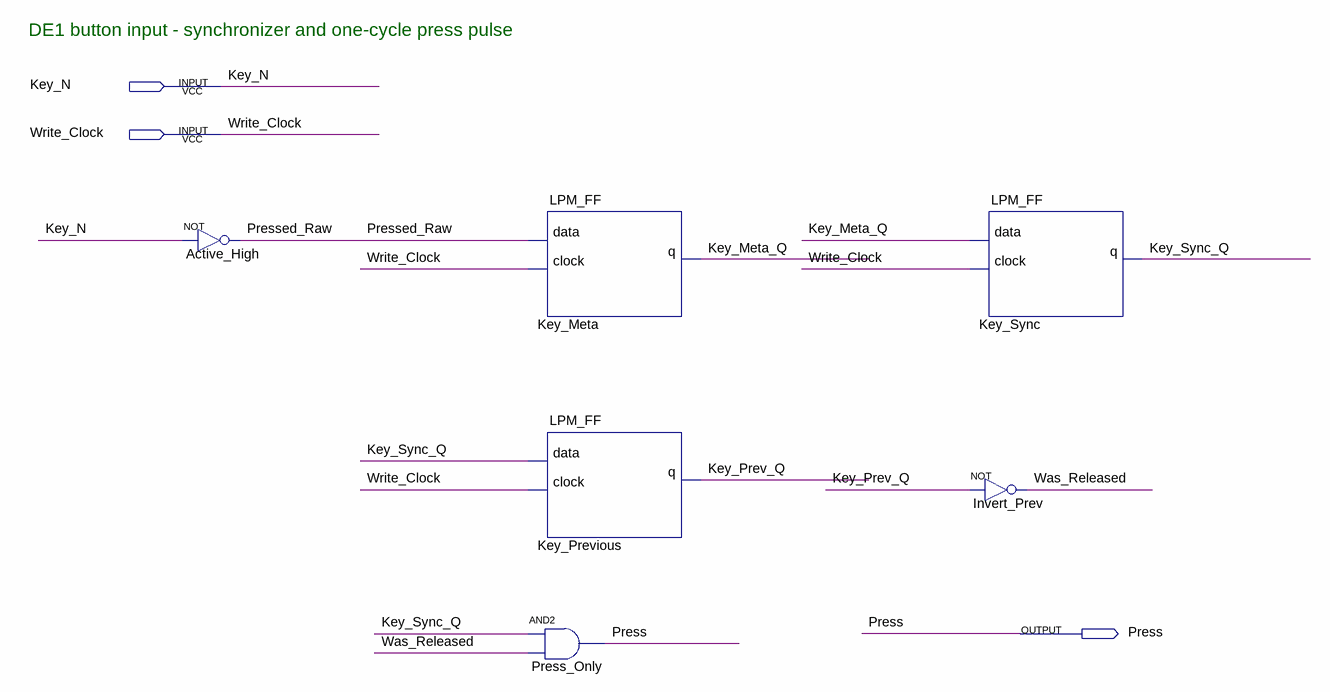
[diagram p0: schematic sheet]
// Quartus schematic Button_Pulse.bdf as structural Verilog: 6 symbols, 3 pins
module Button_Pulse (
  input  Key_N,
  input  Write_Clock,
  output Press
);

  wire Key_Meta_Q, Key_Prev_Q, Key_Sync_Q, Pressed_Raw, Was_Released;

  not Active_High (Pressed_Raw, Key_N);
  LPM_FF #(.LPM_WIDTH(1), .LPM_FFTYPE("DFF")) Key_Meta (.data(Pressed_Raw), .clock(Write_Clock), .q(Key_Meta_Q));
  LPM_FF #(.LPM_WIDTH(1), .LPM_FFTYPE("DFF")) Key_Previous (.data(Key_Sync_Q), .clock(Write_Clock), .q(Key_Prev_Q));
  and Press_Only (Press, Key_Sync_Q, Was_Released);
  LPM_FF #(.LPM_WIDTH(1), .LPM_FFTYPE("DFF")) Key_Sync (.data(Key_Meta_Q), .clock(Write_Clock), .q(Key_Sync_Q));
  not Invert_Prev (Was_Released, Key_Prev_Q);

  // Notes on the sheet:
  //   DE1 button input - synchronizer and one-cycle press pulse
endmodule
